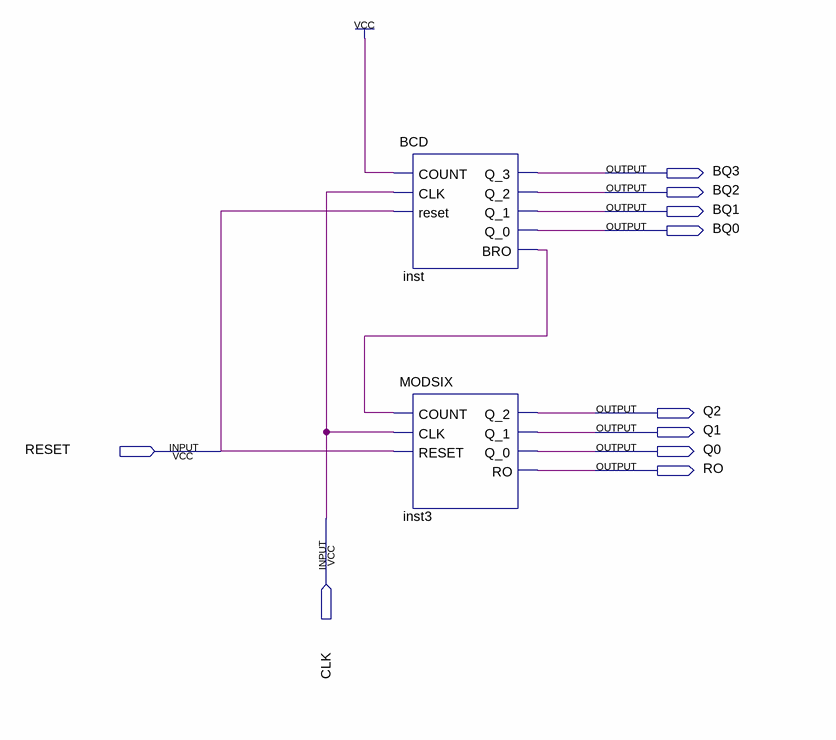
[diagram p0: schematic sheet]
// Quartus schematic MODSIXTY.bdf as structural Verilog: 2 symbols, 10 pins
module MODSIXTY (
  input  RESET,
  input  CLK,
  output BQ3,
  output BQ2,
  output BQ1,
  output BQ0,
  output Q2,
  output Q1,
  output Q0,
  output RO
);

  wire inst_bro;

  BCD inst (.COUNT(1'b1), .CLK(CLK), .reset(RESET), .Q_3(BQ3), .Q_2(BQ2), .Q_1(BQ1), .Q_0(BQ0), .BRO(inst_bro));
  MODSIX inst3 (.COUNT(inst_bro), .CLK(CLK), .RESET(RESET), .Q_2(Q2), .Q_1(Q1), .Q_0(Q0), .RO(RO));
endmodule
